# Altium schematic sheet 2_PD Control TPS26750.SchDoc
size A2; Date: Not shown in title block; ApprovedBy: Not shown in title block; CheckedBy: Not shown in title block; Author: Not shown in title block; CompanyName: Not shown in title block; Engineer: Not shown in title block; Organization: Not shown in title block; Address1: Not shown in title block; Address2: Not shown in title block; Address3: Not shown in title block; Address4: Not shown in title block; DocumentNumber: 2; Revision: Use project parameter SCH_Rev; SheetNumber: 2; SheetTotal: 14; PageSetup: Record=PageOptions|CenterHorizontal=True|CenterVertical=True|PrintScale=1.00|XCorrection=1.00|YCorrection=1.00|PrintKind=0|BorderSize=5000000|LeftOffset=0|BottomOffset=0|Orientation=2|PaperLength=1000|PaperWidth=1000|Scale=100|PaperSource=15|PrintQuality=600|MediaType=1|DitherType=10|PaperKind=Letter|PrintScaleMode=1; CurrentTime: Not shown in title block; CurrentDate: Not shown in title block; Time: Not shown in title block; DocumentFullPathAndName: Not shown in title block; DocumentName: Not shown in title block; ModifiedDate: Not shown in title block; ImagePath: Not shown in title block
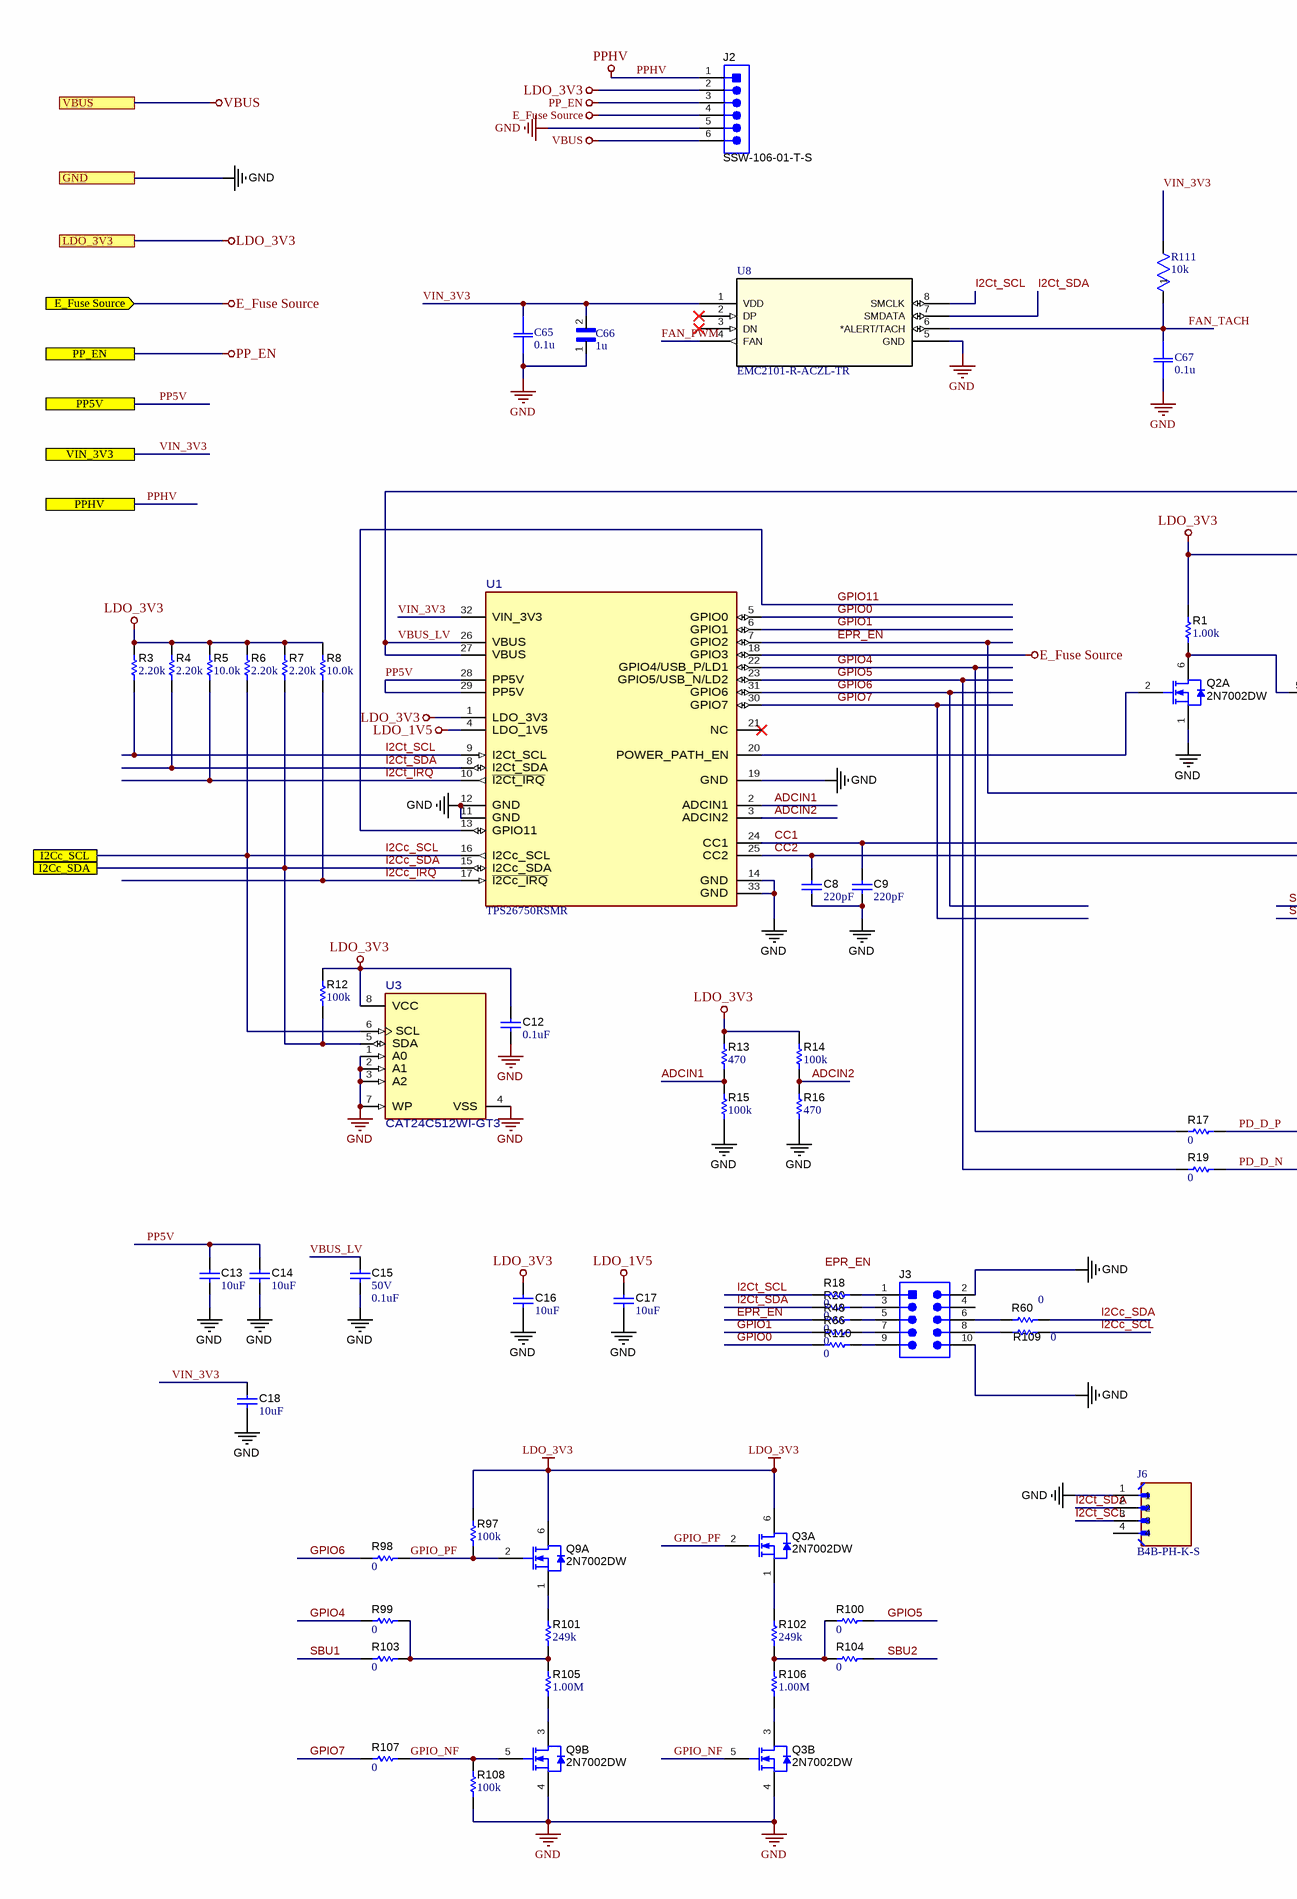
[diagram p0: 2_PD Control TPS26750.SchDoc, left]
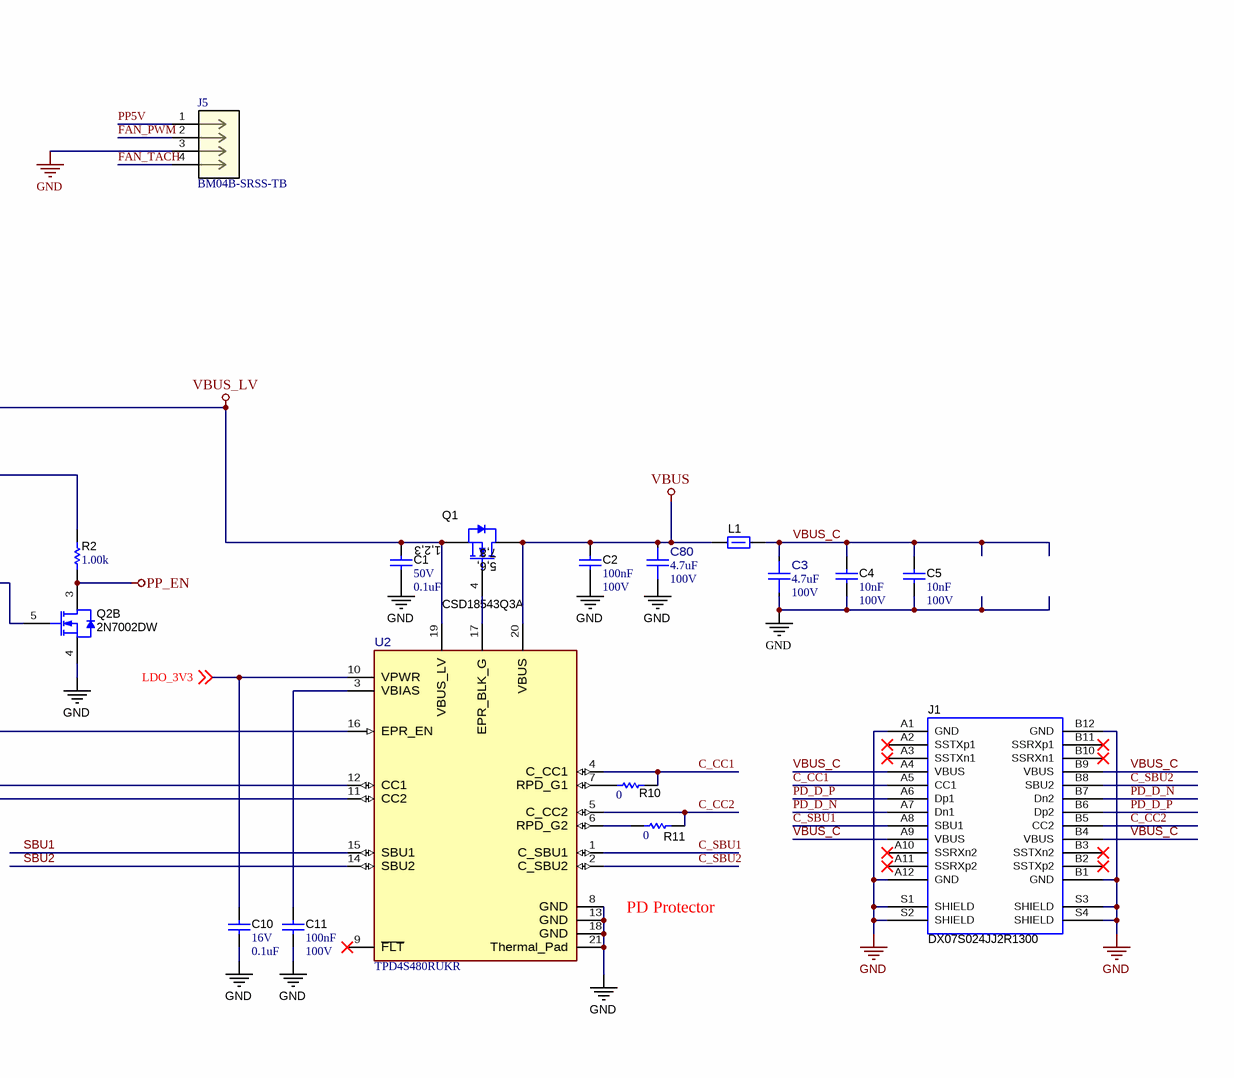
[diagram p1: 2_PD Control TPS26750.SchDoc, right]

## Parts
C1  VDC_V: 50V  ValueDisplayed: 0.1uF  [0402L]  (hidden comment: C1005X5R1H104K050BB)
C2  Cap_F: 100nF  VDC_V: 100V  [0603]  (hidden comment: GRM188R72A104KA35J)
C3  ValueDisplayed: 4.7uF  VDC_V: 100V  [FP-C2012X5R2A475K125AC_0805-MFG]  (hidden comment: C2012X5R2A475K125AC)
C4  Cap_F: 10nF  VDC_V: 100V  [0603L]  (hidden comment: C0603X103K1RACTU)
C5  Cap_F: 10nF  VDC_V: 100V  [0603L]  (hidden comment: C0603X103K1RACTU)
C8  ValueDisplayed: 220pF  [0201_033L]  (hidden comment: CGA1A2X7R1H221K030BA)
C9  ValueDisplayed: 220pF  [0201_033L]  (hidden comment: CGA1A2X7R1H221K030BA)
C10  VDC_V: 16V  ValueDisplayed: 0.1uF  [0402]  (hidden comment: 885012205037)
C11  Cap_F: 100nF  VDC_V: 100V  [0603]  (hidden comment: GRM188R72A104KA35J)
C12  ValueDisplayed: 0.1uF  [0402L]  (hidden comment: CGA2B3X7R1H104K050BB)
C13  ValueDisplayed: 10uF  [0603L]  (hidden comment: GRM188R61E106MA73D)
C14  ValueDisplayed: 10uF  [0603L]  (hidden comment: GRM188R61E106MA73D)
C15  VDC_V: 50V  ValueDisplayed: 0.1uF  [0402L]  (hidden comment: C1005X5R1H104K050BB)
C16  ValueDisplayed: 10uF  [0402_070]  (hidden comment: CL05A106MP5NUNC)
C17  ValueDisplayed: 10uF  [0402_070]  (hidden comment: CL05A106MP5NUNC)
C18  ValueDisplayed: 10uF  [0402_070]  (hidden comment: CL05A106MP5NUNC)
C65  0.1u  [G-188_MUR]
C66  1u  [CAPC2012X145N]
C67  0.1u  [G-188_MUR]
C80  ValueDisplayed: 4.7uF  VDC_V: 100V  [FP-C2012X5R2A475K125AC_0805-MFG]  (hidden comment: C2012X5R2A475K125AC)
J1  DX07S024JJ2R1300  [JAE_DX07S024JJ2R1300]
J2  SSW-106-01-T-S  [Samtec_SSW-106-01-x-S]
J3  PEC05DAAN  [CONN_PEC05DAAN]  (value not drawn)
J5  BM04B-SRSS-TB  [CONN4_BM04B-SRSS_JST]
J6  B4B-PH-K-S  [JST_B4B-PH-K-S]
L1  742792021  [0805L]  (value not drawn)
Q1  CSD18543Q3A  [DNH0008A]
Q2  2N7002DW  [SOT-363]  (parts A,B of 2)
Q3  2N7002DW  [SOT-363]  (parts A,B of 2)
Q9  2N7002DW  [SOT-363]  (parts A,B of 2)
R1  ValueDisplayed: 1.00k  [0402]  (hidden comment: ERJ-2RKF1001X)
R2  ValueDisplayed: 1.00k  [0402]  (hidden comment: ERJ-2RKF1001X)
R3  ValueDisplayed: 2.20k  [0402]  (hidden comment: RC0402FR-072K2L)
R4  ValueDisplayed: 2.20k  [0402]  (hidden comment: RC0402FR-072K2L)
R5  ValueDisplayed: 10.0k  [0402]  (hidden comment: CRCW040210K0DHEDP)
R6  ValueDisplayed: 2.20k  [0402]  (hidden comment: RC0402FR-072K2L)
R7  ValueDisplayed: 2.20k  [0402]  (hidden comment: RC0402FR-072K2L)
R8  ValueDisplayed: 10.0k  [0402]  (hidden comment: CRCW040210K0DHEDP)
R10  ValueDisplayed: 0  [0201L]  (hidden comment: CRCW02010000Z0ED)
R11  ValueDisplayed: 0  [0201L]  (hidden comment: CRCW02010000Z0ED)
R12  ValueDisplayed: 100k  [0201L]  (hidden comment: RC0201FS-7D100KL)
R13  ValueDisplayed: 470  [0603]  (hidden comment: RT0603BRD07470RL)
R14  ValueDisplayed: 100k  [0603L]  (hidden comment: RC0603FR-07100KL)
R15  ValueDisplayed: 100k  [0603L]  (hidden comment: RC0603FR-07100KL)
R16  ValueDisplayed: 470  [0603]  (hidden comment: RT0603BRD07470RL)
R17  ValueDisplayed: 0  [0201L]  (hidden comment: CRCW02010000Z0ED)
R18  ValueDisplayed: 0  [0402]  (hidden comment: RC0402JR-070RL)
R19  ValueDisplayed: 0  [0201L]  (hidden comment: CRCW02010000Z0ED)
R20  ValueDisplayed: 0  [0402]  (hidden comment: RC0402JR-070RL)
R48  ValueDisplayed: 0  [0402]  (hidden comment: RC0402JR-070RL)
R60  ValueDisplayed: 0  [0402]  (hidden comment: RC0402JR-070RL)
R66  ValueDisplayed: 0  [0402]  (hidden comment: RC0402JR-070RL)
R97  ValueDisplayed: 100k  [0402L]  (hidden comment: RC1005F104CS)
R98  ValueDisplayed: 0  [0402]  (hidden comment: RC0402JR-070RL)
R99  ValueDisplayed: 0  [0402]  (hidden comment: RC0402JR-070RL)
R100  ValueDisplayed: 0  [0402]  (hidden comment: RC0402JR-070RL)
R101  ValueDisplayed: 249k  [0603]  (hidden comment: RG1608P-2493-B-T5)
R102  ValueDisplayed: 249k  [0603]  (hidden comment: RG1608P-2493-B-T5)
R103  ValueDisplayed: 0  [0402]  (hidden comment: RC0402JR-070RL)
R104  ValueDisplayed: 0  [0402]  (hidden comment: RC0402JR-070RL)
R105  ValueDisplayed: 1.00M  [0402L]  (hidden comment: ERJ-2RKF1004X)
R106  ValueDisplayed: 1.00M  [0402L]  (hidden comment: ERJ-2RKF1004X)
R107  ValueDisplayed: 0  [0402]  (hidden comment: RC0402JR-070RL)
R108  ValueDisplayed: 100k  [0402L]  (hidden comment: RC1005F104CS)
R109  ValueDisplayed: 0  [0402]  (hidden comment: RC0402JR-070RL)
R110  ValueDisplayed: 0  [0402]  (hidden comment: RC0402JR-070RL)
R111  10k  [RC0402N_VIS]
U1  TPS26750RSMR  [RSM0032B-MFG]
U2  TPD4S480RUKR  [RUK0020B-MFG]
U3  CAT24C512WI-GT3  [FP-CAT24C512WI-GT3_SOIC8-IPC_C]
U8  EMC2101-R-ACZL-TR  [MSOP8_MC_MCH]

## Ports
E_Fuse Source (in), GND, I2Cc_SCL, I2Cc_SDA, LDO_3V3, PP5V, PP_EN, PPHV, VBUS, VIN_3V3

## Nets
E_Fuse Source: J2.4 U1.18(GPIO3) ; port E_Fuse Source
GND: C1.2 C2.2 C3.1 C4.2 C5.2 C8.2 C9.2 C10.2 C11.1 C12.2 C13.2 C14.2 C15.2 C16.1 C17.1 C18.2 C65.1 C66.1 C67.1 C80.1 J1.A1(GND) J1.A12(GND) J1.B1(GND) J1.B12(GND) J1.S1(SHIELD) J1.S2(SHIELD) J1.S3(SHIELD) J1.S4(SHIELD) J2.5 J3.2 J3.10 J5.3 J6.1 Q2.1(S) Q2.4(S) Q3.4(S) Q9.4(S) R15.1 R16.1 R108.1 U1.11(GND) U1.12(GND) U1.14(GND) U1.19(GND) U1.33(GND) U2.8(GND) U2.13(GND) U2.18(GND) U2.21(Thermal_Pad) U3.1(A0) U3.2(A1) U3.3(A2) U3.4(VSS) U3.7(WP) U8.5(GND) ; port GND
LDO_1V5: C17.2 U1.4(LDO_1V5)
LDO_3V3: C10.1 C12.1 C16.2 J2.2 Q3.6(D) Q9.6(D) R1.2 R2.2 R3.2 R4.2 R5.2 R6.2 R7.2 R8.2 R12.2 R13.2 R14.2 R97.2 U1.1(LDO_3V3) U2.10(VPWR) U3.8(VCC) ; off-sheet LDO_3V3, port LDO_3V3
PP_EN: J2.3 Q2.3(D) R2.1 ; port PP_EN
PPHV: J2.1 ; port PPHV
VBUS: C2.1 C80.2 J2.6 L1.1 Q1.5(D) Q1.6(D) Q1.7(D) Q1.8(D) Q1.9(D) U2.20(VBUS) ; port VBUS
VBUS_LV: C1.1 C15.1 Q1.1(S) Q1.2(S) Q1.3(S) U1.26(VBUS) U1.27(VBUS) U2.19(VBUS_LV)
ADCIN1: R13.1 R15.2 U1.2(ADCIN1)
ADCIN2: R14.1 R16.2 U1.3(ADCIN2)
C_CC1: J1.A5(CC1) R10.2 U2.4(C_CC1)
C_CC2: J1.B5(CC2) R11.2 U2.5(C_CC2)
C_SBU1: J1.A8(SBU1) U2.1(C_SBU1)
C_SBU2: J1.B8(SBU2) U2.2(C_SBU2)
CC1: C9.1 U1.24(CC1) U2.12(CC1)
CC2: C8.1 U1.25(CC2) U2.11(CC2)
EPR_EN: R48.1 U1.7(GPIO2) U2.16(EPR_EN)
FAN_PWM: J5.2 U8.4(FAN)
FAN_TACH: C67.2 J5.4 R111.1 U8.6(*ALERT/TACH)
GPIO0: R110.1 U1.5(GPIO0)
GPIO1: R66.1 U1.6(GPIO1)
GPIO4: R17.1 R99.1 U1.22(GPIO4/USB_P/LD1)
GPIO5: R19.1 R100.2 U1.23(GPIO5/USB_N/LD2)
GPIO6: R98.1 U1.31(GPIO6)
GPIO7: R107.1 U1.30(GPIO7)
GPIO11: U1.13(GPIO11)
GPIO_NF: Q3.5(G) Q9.5(G) R107.2 R108.2
GPIO_PF: Q3.2(G) Q9.2(G) R97.1 R98.2
I2Cc_SCL: R6.1 R109.2 U1.16(I2Cc_SCL) U3.6(SCL) ; port I2Cc_SCL
I2Cc_SDA: R7.1 R12.1 R60.2 U1.15(I2Cc_SDA) U3.5(SDA) ; port I2Cc_SDA
I2Ct_SCL: J6.3 R3.1 R18.1 U1.9(I2Ct_SCL) U8.8(SMCLK)
I2Ct_SDA: J6.2 R4.1 R20.1 U1.8(I2Ct_SDA) U8.7(SMDATA)
~{I2Cc_IRQ}: R8.1 U1.17(~{I2Cc_IRQ})
~{I2Ct_IRQ}: R5.1 U1.10(~{I2Ct_IRQ})
PD_D_N: J1.A7(Dn1) J1.B7(Dn2) R19.2
PD_D_P: J1.A6(Dp1) J1.B6(Dp2) R17.2
PP5V: C13.1 C14.1 J5.1 U1.28(PP5V) U1.29(PP5V) ; port PP5V
SBU1: R103.1 U2.15(SBU1)
SBU2: R104.2 U2.14(SBU2)
VBUS_C: C3.2 C4.1 C5.1 J1.A4(VBUS) J1.A9(VBUS) J1.B4(VBUS) J1.B9(VBUS) L1.2
VIN_3V3: C18.1 C65.2 C66.2 R111.2 U1.32(VIN_3V3) U8.1(VDD) ; port VIN_3V3
NetC11_2: C11.2 U2.3(VBIAS)
NetJ3_1: J3.1 R18.2
NetJ3_3: J3.3 R20.2
NetJ3_5: J3.5 R48.2
NetJ3_6: J3.6 R60.1
NetJ3_7: J3.7 R66.2
NetJ3_8: J3.8 R109.1
NetJ3_9: J3.9 R110.2
NetQ1_4: Q1.4(G) U2.17(EPR_BLK_G)
NetQ2_2: Q2.2(G) U1.20(POWER_PATH_EN)
NetQ2_5: Q2.5(G) Q2.6(D) R1.1
NetQ3_1: Q3.1(S) R102.2
NetQ3_3: Q3.3(D) R106.1
NetQ9_1: Q9.1(S) R101.2
NetQ9_3: Q9.3(D) R105.1
NetR10_1: R10.1 U2.7(RPD_G1)
NetR11_1: R11.1 U2.6(RPD_G2)
NetR99_2: R99.2 R101.1 R103.2 R105.2
NetR100_1: R100.1 R102.1 R104.1 R106.2

Not connected (* = marked no-connect by the designer): J1 A2(SSTXp1)* A3(SSTXn1)* A10(SSRXn2)* A11(SSRXp2)* B2(SSTXp2)* B3(SSTXn2)* B10(SSRXn1)* B11(SSRXp1)*; J3 4; J6 4; U1 21(NC)*; U2 9(~{FLT})*; U8 2(DP)* 3(DN)*

## Notes on the sheet
- (near U2) PD Protector
- Labels drawn without touching a wire or pin: EPR_EN
- Orderable:
- Designed for:
- Mod. Date:
- Texas Instruments and/or its licensors do not warrant the accuracy or completeness of this specification or any information contained therein. Texas Instruments and/or its licensors do not warrant that this design will meet the specifications, will be suitable for your application or fit for any particular purpose, or will operate in an implementation. Texas Instruments and/or its licensors do not warrant that the design is production worthy. You should completely validate and test your design implementation to confirm the system functionality for your application.
- Drawn By:
- Engineer:
- SVN Rev:
- Number:
- TID #:
- Rev:
- Sheet Title:
- File:
- Contact:
- Project Title:
- Assembly Variant:
- Sheet:
- Size:
- of
- A2
- © Texas Instruments
- http://www.ti.com
- (in symbol CMP-0000826-2) 1,2,3; 7,8; 5,6,

## Library data of the parts
C1 C15 = CMP-0006279-2: CAP, CERM, 0.1 uF, 50 V, +/- 10%, X5R, 0402; Manufacturer: TDK; TaMin_C: -55°C; ESR_ohm: 39.064m; Polarized: N; SizeAreaWB_mm2: 3; Value1: 0.039064 ohm; U/M: EA; Value: 0.1uF; TaMax_C: 85°C; SizeZ_mm: 0.6; SizeX_mm: 1; SizeY_mm: 0.5; Cap_Case: 0402; Cap_F: 100nF; IRMS_A: 814.669mA; AEC Category: Q200; Supplier Part Number 2: 810-C1005X5R1H104K050BB; Publisher: Texas Instruments; Supplier 2: Mouser; TempCo: X5R; Published: 2008-06-19; RoHS: Y; MountType: SMT; Supplier 1: Digi-Key; PackageReference: 0402; Tolerance_%: 10%; Value2: 50V; SizeArea_mm2: 0.5; CompType: Capacitor; LatestRevisionDate: 2017-03-09; PartNumber: C1005X5R1H104K050BB; AEC Qualified: N; ComponentLink1Description: Datasheet link; AEC Grade: N/A; Supplier Part Number 1: 445-5942-1-ND; Technology: Ceramic; ComponentLink1URL: https://product.tdk.com/en/search/capacitor/ceramic/mlcc/info?part_no=C1005X5R1H104K050BB
C2 C11 = CMP-0007470-4: CAP, CERM, 0.1 uF, 100 V, +/- 10%, X7R, 0603; Manufacturer: MuRata; TaMin_C: -55°C; Polarized: N; SizeAreaWB_mm2: 4.68; Value1: Unknown; U/M: EA; Value: 0.1uF; TaMax_C: 125°C; SizeZ_mm: 1; SizeX_mm: 1.6; SizeY_mm: 0.8; SizeArea_mm2: 1.28; AEC Category: Q200; Supplier Part Number 2: 81-GRM188R72A104KA5J; Publisher: Texas Instruments; Supplier 2: Mouser; TempCo: X7R; Published: 2008-06-19; RoHS: Y; MountType: SMT; Supplier 1: Digi-Key; PackageReference: 0603; Tolerance_%: 10%; Cap_Case: 0603; Value2: 100V; CompType: Capacitor; LatestRevisionDate: 2017-03-09; PartNumber: GRM188R72A104KA35J; AEC Qualified: ?; ComponentLink1Description: Datasheet link; Supplier Part Number 1: 490-6439-1-ND; Technology: Ceramic; ValueDisplayed: 0.1uF; ComponentLink1URL: http://search.murata.co.jp/Ceramy/image/img/A01X/G101/ENG/GRM188R72A104KA35-01.pdf
C3 C80 = CMP-0098058-1: 4.7 µF ±10% 100V Ceramic Capacitor X5R 0805 (2012 Metric); Manufacturer: TDK; AEC Qualified: No; SizeZ_mm: 1.5mm; Value: 4.7µF; TempCo: 15%; ComponentLink1URL: https://product.tdk.com/en/search/capacitor/ceramic/mlcc/info?part_no=C2012X5R2A475K125AC; helpURL: https://upverter.com/upn/revision/d7b95d178f122935/; Datasheet Path: datasheets/Cap-C2012X5R2A475K125AC.pdf; datasheet: https://product.tdk.com/en/search/capacitor/ceramic/mlcc/info?part_no=C2012X5R2A475K125AC; Supplier Part Number 1: 445-C2012X5R2A475K125ACCT-ND; ComponentLink1Description: Datasheet; PackageReference: 0805; Tolerance_%: 10%; Mouser Description: Multilayer Ceramic Chip Capacitors, Capacitance=4.7µF, LxWxT: 2x1.25x1.25mm; Supplier 2: Mouser; Supplier Part Number 2: 810-C2012X5R2A475K12; Part Number: C2012X5R2A475K125AC; Cap_F: 4.7µF; Temperature Characteristic: X5R; Supplier 1: Digikey; Lead Free: Yes; Digikey Part Number: 445-C2012X5R2A475K125ACCT-ND; Operating Temperature Range: -55°C to +85°C; Digikey Description: CAP CER 4.7UF 100V X5R 0805; RoHS: TRUE; PartNumber: C2012X5R2A475K125AC; Mouser Part Number: 810-C2012X5R2A475K12
C4 C5 = CMP-0006977-4: CAP, CERM, 0.01 uF, 100 V, +/- 10%, X7R, 0603; Manufacturer: Kemet; TaMin_C: -55°C; Polarized: N; SizeAreaWB_mm2: 4.68; Value1: Unknown; U/M: EA; Value: 0.01uF; TaMax_C: 125°C; SizeZ_mm: 1; SizeX_mm: 1.6; SizeY_mm: 0.8; Cap_Case: 0603; SizeArea_mm2: 1.28; AEC Category: Q200; Supplier Part Number 2: 80-C0603X103K1R; Publisher: Texas Instruments; Supplier 2: Mouser; TempCo: X7R; Published: 2008-06-19; RoHS: Y; MountType: SMT; Supplier 1: Digi-Key; PackageReference: 0603; Tolerance_%: 10%; Value2: 100V; CompType: Capacitor; LatestRevisionDate: 2017-03-09; PartNumber: C0603X103K1RACTU; AEC Qualified: ?; ComponentLink1Description: Datasheet link; Supplier Part Number 1: 399-5347-1-ND; Technology: Ceramic; ValueDisplayed: 0.01uF; ComponentLink1URL: http://www.kemet.com/kemet/web/homepage/kechome.nsf/vapubfiles/F3102_Y5V.pdf/$file/F3102_Y5V.pdf
C8 C9 = CMP-0009652-3: CAP, CERM, 220 pF, 50 V, +/- 10%, X7R, AEC-Q200 Grade 1, 0201; Manufacturer: TDK; TaMin_C: -55°C; ESR_ohm: 11.6275; Polarized: N; SizeAreaWB_mm2: 2.08; Value1: 11.6275 ohm; U/M: EA; Value: 220pF; TaMax_C: 125°C; SizeZ_mm: 0.33; SizeX_mm: 0.6; SizeY_mm: 0.3; Cap_Case: 0201_033; Value2: 50V; SizeArea_mm2: 0.18; AEC Qualified: Y; IRMS_A: 200.785mA; AEC Grade: 1; AEC Category: Q200; Supplier Part Number 2: 810-CGA1A2X7R1H221K030BA; Publisher: Texas Instruments; Supplier 2: Mouser; TempCo: X7R; Published: 2008-06-19; RoHS: Y; MountType: SMT; Supplier 1: Digi-Key; PackageReference: 0201; Tolerance_%: 10%; CompType: Capacitor; LatestRevisionDate: 2017-03-09; PartNumber: CGA1A2X7R1H221K030BA; Cap_F: 220pF; VDC_V: 50V; ComponentLink1Description: Datasheet link; Supplier Part Number 1: 445-12109-1-ND; Technology: Ceramic; ComponentLink1URL: https://product.tdk.com/en/search/capacitor/ceramic/mlcc/info?part_no=CGA1A2X7R1H221K030BA
C10 = CMP-0006228-1: CAP, CERM, 0.1 uF, 16 V, +/- 10%, X7R, 0402; Manufacturer: Wurth Elektronik; TaMin_C: -55°C; Polarized: N; SizeAreaWB_mm2: 3; Value1: Unknown; U/M: EA; Value: 0.1uF; TaMax_C: 125°C; SizeZ_mm: 0.6; SizeX_mm: 1; SizeY_mm: 0.5; Cap_F: 100nF; AEC Category: Q200; ComponentLink1URL: http://katalog.we-online.de/pbs/datasheet/885012205037.pdf; Supplier Part Number 2: 710-885012205037; Publisher: Texas Instruments; Supplier 2: Mouser; TempCo: X7R; Published: 2008-06-19; RoHS: Y; MountType: SMT; Supplier 1: Digi-Key; PackageReference: 0402; Tolerance_%: 10%; Cap_Case: 0402; Value2: 16V; SizeArea_mm2: 0.5; CompType: Capacitor; LatestRevisionDate: 2017-03-09; PartNumber: 885012205037; AEC Qualified: N; ComponentLink1Description: Datasheet link; AEC Grade: N/A; Supplier Part Number 1: 732-7532-1-ND; Technology: Ceramic
C12 = CMP-0006325-2: CAP, CERM, 0.1 uF, 50 V, +/- 10%, X7R, AEC-Q200 Grade 1, 0402; Manufacturer: TDK; TaMin_C: -55°C; ESR_ohm: 39.064m; Polarized: N; SizeAreaWB_mm2: 3; Value1: 0.039064 ohm; U/M: EA; Value: 0.1uF; TaMax_C: 125°C; SizeZ_mm: 0.6; SizeX_mm: 1; SizeY_mm: 0.5; Cap_Case: 0402; Value2: 50V; AEC Qualified: Y; Cap_F: 100nF; IRMS_A: 814.669mA; AEC Category: Q200; Supplier Part Number 2: 04X3148; Publisher: Texas Instruments; Supplier 2: Newark; Supplier Part Number 3: 810-CGA2B3X7R1H104K; TempCo: X7R; Supplier 3: Mouser; Published: 2008-06-19; RoHS: Y; MountType: SMT; Supplier 1: Digi-Key; PackageReference: 0402; Tolerance_%: 10%; SizeArea_mm2: 0.5; CompType: Capacitor; LatestRevisionDate: 2017-03-09; PartNumber: CGA2B3X7R1H104K050BB; VDC_V: 50V; ComponentLink1Description: Datasheet link; AEC Grade: 1; Supplier Part Number 1: 445-6899-1-ND; Technology: Ceramic; ComponentLink1URL: https://product.tdk.com/en/search/capacitor/ceramic/mlcc/info?part_no=CGA2B3X7R1H104K050BB
C13 C14 = CMP-0007344-5: CAP, CERM, 10 uF, 25 V, +/- 20%, X5R, 0603; Manufacturer: MuRata; TaMin_C: -55°C; Polarized: N; SizeAreaWB_mm2: 4.68; Value1: Unknown; U/M: EA; Value: 10uF; TaMax_C: 85°C; SizeZ_mm: 1; SizeX_mm: 1.6; SizeY_mm: 0.8; Cap_Case: 0603; Value2: 25V; SizeArea_mm2: 1.28; Cap_F: 10µF; AEC Category: Q200; Supplier Part Number 2: 81-GRM188R61E106MA3L; Publisher: Texas Instruments; Supplier 2: Mouser; Supplier Part Number 3: 1828803RL; TempCo: X5R; Supplier 3: Farnell; Published: 2008-06-19; RoHS: Y; MountType: SMT; Supplier 1: Digi-Key; PackageReference: 0603; Tolerance_%: 20%; CompType: Capacitor; LatestRevisionDate: 2017-03-09; PartNumber: GRM188R61E106MA73D; AEC Qualified: ?; VDC_V: 25V; ComponentLink1Description: Datasheet link; Supplier Part Number 1: 490-7202-1-ND; Technology: Ceramic; ComponentLink1URL: http://psearch.murata.com/capacitor/product/GRM188R61E106MA73%23.pdf
C16-C18 = CMP-0006339-4: CAP, CERM, 10 uF, 10 V, +/- 20%, X5R, 0402; Manufacturer: Samsung Electro-Mechanics; TaMin_C: -55°C; Polarized: N; SizeAreaWB_mm2: 3; Value1: Unknown; U/M: EA; Value: 10uF; TaMax_C: 85°C; SizeZ_mm: 0.6; SizeX_mm: 1; SizeY_mm: 0.5; Cap_Case: 0402; Value2: 10V; Cap_F: 10µF; AEC Category: Q200; TempCo: X5R; RoHS: Y; MountType: SMT; PackageReference: 0402; Tolerance_%: 20%; SizeArea_mm2: 0.5; CompType: Capacitor; PartNumber: CL05A106MP5NUNC; AEC Qualified: N; VDC_V: 10V; ComponentLink1Description: Datasheet link; Technology: Ceramic; ComponentLink1URL: http://www.samsungsem.com/kr/support/product-search/mlcc/__icsFiles/afieldfile/2018/06/21/CL05A106MP5NUNC.pdf; AEC Grade: N/A
C65 C67 = GRM188R72A104KA35J: CAP, CERM, 0.1 uF, 100 V, +/- 10%, X7R, 0603; Manufacturer_Name: Murata; Copyright: Copyright (C) 2026 Ultra Librarian. All rights reserved.; Manufacturer_Part_Number: GRM188R72A104KA35J
C66 = C2012X7S2A105K125AB: 1 ÂµF Â±10% 100V Ceramic Capacitor X7S 0805 (2012 Metric); MF: {'manufacturer': u'TDK Corporation'}; Package: None; Price: None; Value: *; MP: C2012X7S2A105K125AB; Availability: Unavailable
J1 = CMP-0085712-2: Receptacle, USB 3.1 Type C, R/A, Gold, SMT; Manufacturer: JAE Electronics; Current_A: 1.25A; Gender: Female; Voltage_V: 20V; Pitch_mm: 0.5; Row_Count: 2; ComponentLink1Description: Datasheet URL; CompType: USB; ComponentLink1URL: http://www.jae.com/z-en/pdf_download_exec.cfm?param=SJ115946.pdf; PinCount: 24; ContactFinish: Gold; PartNumber: DX07S024JJ2R1300; MountType: SMT; PackageReference: Receptacle, USB 3.1 Type C, R/A, SMT; Orientation: R/A; Color: Black; RoHS: Y
J2 = CMP-0075621-1: Receptacle, 6x1, 2.54mm, Tin, TH; Manufacturer: Samtec; Pitch_mm: 2.54; Gender: Female; Cert_CSA: Y; Current_A: 5.7A; CT: False; Row_Count: 1; ComponentLink1Description: Datasheet URL; RoHS: Y; Supplier 1: Digi-Key; Cert_UL: Y; Orientation: Vertical; PackageReference: Receptacle, 6x1, 2.54mm, TH; Color: Black; PartNumber: SSW-106-01-T-S; PinCount: 6; Publisher: Texas Instruments; ContactFinish: Tin; ComponentLink1URL: http://suddendocs.samtec.com/catalog_english/ssw_sm.pdf; LatestRevisionDate: 2017-07-12; CompType: Receptacle; CNHeader: False; MountType: TH; Supplier Part Number 1: SAM1213-06-ND
J3 = CMP-0054550-2: Header, 100mil, 5x2, Tin, TH; Manufacturer: Sullins Connector Solutions; Current_A: 3A; Green_Lifecycle: Active; Shrouded: N; Gender: Male; Green_REACh: Passed; Voltage_V: 1.8kV; Row_Count: 2; RowSpacing_mm: 2.54; Cert_UL: Y; ComponentLink1URL: http://www.sullinscorp.com/catalogs/77_PAGE108-109_.100_MALE_HDR.pdf; ClassName: Header; Color: Black; RoHS: Y; MountType: TH; Green_EU RoHS-2: Passed; Supplier 1: Digi-Key; Green_EU RoHS: Passed; PackageReference: Header, 5x2, 100mil, Tin; PinCount: 10; CompType: Header; PartNumber: PEC05DAAN; Orientation: Vertical; ComponentLink1Description: Datasheet URL; Supplier Part Number 1: S2012E-05-ND; Pitch_mm: 2.54; ContactFinish: Tin
J5 = BM04B-SRSS-TB: Description; Manufacturer_Name: JST; Type: Headers, Male Pins; Copyright: Copyright (C) 2025 Ultra Librarian. All rights reserved.; Manufacturer_Part_Number: BM04B-SRSS-TB; RefDes: RefDes
J6 = B4B-PH-K-S: MF: {'manufacturer': u'JST Sales America Inc.'}; Package: None; Price: None; Value: *; MP: B4B-PH-K-S; Availability: Unavailable
L1 = CMP-0003072-1: Ferrite Bead, 22 ohm @ 100 MHz, 6 A, 0805; Manufacturer: Wurth Elektronik; Ztyp@1GHz_Ohm: 40.219; ZTyp@100MHz_Ohm: 22; SizeAreaWB_mm2: 6.75; DCR_ohm: 8m; Value1: 0.008 ohm; Value: 22 ohm; Imax_A: 6A; SizeZ_mm: 1.45; SizeX_mm: 2; SizeY_mm: 1.25; SizeArea_mm2: 2.5; ComponentLink1URL: http://katalog.we-online.de/pbs/datasheet/742792021.pdf; Supplier Part Number 2: 710-742792021; Publisher: Texas Instruments; Supplier 2: Mouser; Published: 2014-04-30; RoHS: Y; MountType: SMT; Supplier 1: Digi-Key; PackageReference: 0805; Value2: 6A; CompType: Ferrite Bead; LatestRevisionDate: 2017-03-09; PartNumber: 742792021; ComponentLink1Description: Datasheet link; Supplier Part Number 1: 732-4637-1-ND; ValueDisplayed: 22 ohm
Q1 = CMP-0000826-2: MOSFET, N-CH, 60 V, 35 A, DNH0008A (VSONP-8); Alternate Manufacturer: None; Manufacturer: Texas Instruments; SizeZ_mm: 0.9; ChType: N; Value2: 11.1 nC; Value1: 0.01; VdsMax_V: 60V; SizeX_mm: 3.3; SizeAreaWB_mm2: 18.49; Vgs_V: 20V; QgTyp_nC: 11.1; Value: 60V; Rdson45_ohm: 12m; SizeArea_mm2: 10.89; AEC Category: Q101; IdsMax_A: 35A; ChMode: Enhancement; Supplier 1: Digi-Key; Supplier Part Number 1: CSD18543Q3A-ND; PartNumber: CSD18543Q3A; ComponentLink1Description: Datasheet link; ComponentLink1URL: http://www.ti.com/lit/ds/symlink/csd18543q3a.pdf; SizeY_mm: 3.3; CompType: MOSFET; AEC Qualified: N; RoHS: Y; PackageReference: DNH0008A; MountType: SMT
Q2 Q3 Q9 = CMP-0000770-1: MOSFET, 2-CH, N-CH, 60 V, 0.115 A, SOT-363; Alternate Manufacturer: None; Manufacturer: Fairchild Semiconductor; SizeZ_mm: 1.1; ChType: N; VdsMax_V: 60V; SizeX_mm: 2.2; Vgs_V: 20V; Value: 60V; SizeArea_mm2: 4.84; AEC Category: Q101; IdsMax_A: 115mA; SizeAreaWB_mm2: 10.24; U/M: EA; Supplier 2: Newark; Supplier 3: Farnell; Supplier 1: Digi-Key; Supplier Part Number 1: 2N7002DWCT-ND; Supplier Part Number 2: 05R0387; PartNumber: 2N7002DW; ComponentLink1Description: Datasheet link; LatestRevisionDate: 2017-03-09; ComponentLink1URL: https://www.fairchildsemi.com/datasheets/2N/2N7002DW.pdf; SizeY_mm: 2.2; CompType: MOSFET; PackageReference: SOT-363; LatestRevisionNote: Added parts.; Publisher: Texas Instruments; AEC Qualified: N; Published: 2008-06-19; Supplier Part Number 3: 2464117; RoHS: Y; MountType: SMT
R1 R2 = CMP-0026657-1: RES, 1.00 k, 1%, 0.1 W, 0402; Manufacturer: Panasonic; Power_W: 100mW; TempCo: 100 ppm/C; Value_Code: 1k00; U/M: EA; Value: 1.00k; EIA_Code: E96; Res_ohm: 1k; SizeX_mm: 1; SizeY_mm: 0.5; SizeZ_mm: 0.6; Value2: 0.1W; VDC_V: 50V; AEC Category: Q200; ComponentLink1URL: http://industrial.panasonic.com/www-data/pdf/AOA0000/AOA0000CE2.pdf; Supplier Part Number 2: 64R5247; Publisher: Texas Instruments; Supplier 2: Newark; Supplier Part Number 3: 667-ERJ-2RKF1001X; Supplier 3: Mouser; Published: 2008-06-26; RoHS: Y; Value1: 1%; MountType: SMT; Supplier 1: Digi-Key; PackageReference: 0402; Tolerance_%: 1%; SizeArea_mm2: 0.5; CompType: Resistor; LatestRevisionDate: 2017-03-09; PartNumber: ERJ-2RKF1001X; AEC Qualified: ?; ComponentLink1Description: Datasheet link; Supplier Part Number 1: P1.00KLCT-ND; Technology: Thick Film
R3 R4 R6 R7 = CMP-0026729-1: RES, 2.20 k, 1%, 0.063 W, 0402; Manufacturer: Yageo America; Power_W: 63mW; TempCo: 100 ppm/C; Value_Code: 2k20; U/M: EA; Value: 2.20k; Res_ohm: 2.2k; SizeX_mm: 1; SizeY_mm: 0.5; SizeZ_mm: 0.6; Value2: 0.063W; AEC Qualified: N; AEC Category: Q200; ComponentLink1URL: http://www.yageo.com/documents/recent/PYu-RC_Group_51_RoHS_L_1.pdf; Supplier Part Number 2: 67R9903; Publisher: Texas Instruments; Supplier 2: Newark; Supplier Part Number 3: 603-RC0402FR-072K2L; Supplier 3: Mouser; Published: 2008-06-26; RoHS: Y; Value1: 1%; MountType: SMT; Supplier 1: Digi-Key; PackageReference: 0402; Tolerance_%: 1%; SizeArea_mm2: 0.5; CompType: Resistor; LatestRevisionDate: 2017-03-09; PartNumber: RC0402FR-072K2L; ComponentLink1Description: Datasheet link; AEC Grade: N/A; Supplier Part Number 1: 311-2.20KLRCT-ND; Technology: Thick Film
R5 R8 = CMP-0026769-1: RES, 10.0 k, 0.5%, 0.063 W, 0402; Manufacturer: Vishay-Dale; Power_W: 63mW; TempCo: 50 ppm/C; Value_Code: 10k0; U/M: EA; Value: 10.0k; EIA_Code: E192; Res_ohm: 10k; SizeX_mm: 1; SizeY_mm: 0.5; SizeZ_mm: 0.6; Value2: 0.063W; VDC_V: 50V; AEC Category: Q200; ComponentLink1URL: http://www.vishay.com/docs/20036/dcrcwpe3.pdf; Supplier Part Number 2: 51X8307; Publisher: Texas Instruments; Supplier 2: Newark; Supplier Part Number 3: 71-CRCW040210K0DHEDP; Supplier 3: Mouser; Published: 2008-06-26; RoHS: Y; Value1: 0.5%; MountType: SMT; Supplier 1: Digi-Key; PackageReference: 0402; Tolerance_%: 0.5%; SizeArea_mm2: 0.5; CompType: Resistor; LatestRevisionDate: 2017-03-09; PartNumber: CRCW040210K0DHEDP; AEC Qualified: ?; ComponentLink1Description: Datasheet link; Supplier Part Number 1: 541-10KAVCT-ND; Technology: Thick Film
R10 R11 R17 R19 = CMP-0027008-4: RES, 0, 5%, 0.05 W, 0201; Manufacturer: Vishay-Dale; Power_W: 50mW; TempCo: ppm/C; Value_Code: 0000; Value: 0; EIA_Code: E24; SizeX_mm: 0.6; SizeY_mm: 0.3; SizeZ_mm: 0.26; Value2: 0.05W; SizeArea_mm2: 0.18; AEC Qualified: N; AEC Category: Q200; ComponentLink1URL: http://www.vishay.com/docs/20052/crcw0201e3.pdf; RoHS: E; Value1: 5%; MountType: SMT; Supplier 1: Newark; PackageReference: 0201; Tolerance_%: 5%; Res_ohm: 0; CompType: Resistor; PartNumber: CRCW02010000Z0ED; ComponentLink1Description: Datasheet link; AEC Grade: N/A; Supplier Part Number 1: 72M6743; Technology: Thick Film
R12 = CMP-0028069-1: RES, 100 k, 1%, 0.05 W, 0201; Manufacturer: Yageo America; Power_W: 50mW; TempCo: 200 ppm/C; U/M: EA; Value: 100k; EIA_Code: E96; SizeX_mm: 0.6; SizeY_mm: 0.3; SizeZ_mm: 0.26; Value2: 0.05W; SizeArea_mm2: 0.18; AEC Qualified: N; VDC_V: 25V; AEC Category: Q200; ComponentLink1URL: http://www.yageo.com/documents/recent/PYu-RC_Group_51_RoHS_L_5.pdf; Publisher: Texas Instruments; Published: 2016-10-14; Value_Code: 100k; RoHS: Y; Value1: 1%; MountType: SMT; Supplier 1: Mouser; PackageReference: 0201; Tolerance_%: 1%; Res_ohm: 100k; CompType: Resistor; LatestRevisionDate: 2017-03-09; PartNumber: RC0201FS-7D100KL; ComponentLink1Description: Datasheet link; AEC Grade: N/A; Supplier Part Number 1: 603-RC0201FS-7D100KL; Technology: Thick Film
R13 R16 = CMP-0024263-1: RES, 470, 0.1%, 0.1 W, 0603; Manufacturer: Yageo America; Power_W: 100mW; TempCo: 25 ppm/C; Value_Code: 470R; U/M: EA; Value: 470; EIA_Code: E192; SizeX_mm: 1.6; SizeY_mm: 0.8; SizeZ_mm: 1; Value2: 0.1W; SizeArea_mm2: 1.28; VDC_V: 75V; AEC Category: Q200; ComponentLink1URL: http://www.yageo.com/pdf/PYu-RT_1-to-0.05_RoHS_L_3.pdf; Publisher: Texas Instruments; Published: 2008-06-26; RoHS: Y; Value1: 0.1%; MountType: SMT; PackageReference: 0603; Tolerance_%: 0.1%; Res_ohm: 470; CompType: Resistor; LatestRevisionDate: 2017-03-09; PartNumber: RT0603BRD07470RL; AEC Qualified: ?; ComponentLink1Description: Datasheet link; Technology: Thin Film
R14 R15 = CMP-0022735-5: RES, 100 k, 1%, 0.1 W, 0603; Manufacturer: Yageo; Power_W: 100mW; TempCo: 100 ppm/C; Value: 100k; EIA_Code: E96; SizeX_mm: 1.6; SizeY_mm: 0.8; SizeZ_mm: 1; Value2: 0.1W; SizeArea_mm2: 1.28; AEC Qualified: N; VDC_V: 75V; AEC Category: Q200; SizeAreaWB_mm2: 4.68; Supplier Part Number 2: 603-RC0603FR-07100KL; Supplier 2: Mouser; Supplier Part Number 3: 9238727; Supplier 3: Farnell; Value_Code: 100k; RoHS: Y; Value1: 1%; MountType: SMT; Supplier 1: Digi-Key; PackageReference: 0603; Tolerance_%: 1%; Res_ohm: 100k; CompType: Resistor; PartNumber: RC0603FR-07100KL; ComponentLink1Description: Datasheet link; Supplier Part Number 1: 311-100KHRCT-ND; Technology: Thick Film; ComponentLink1URL: http://www.yageo.com/pdf/Pu-RC0603_51_PbFree_L_2.pdf; AEC Grade: N/A
R18 R20 R48 R60 R66 R98-R100 R103 R104 R107 R109 R110 = CMP-0027004-1: RES, 0, 5%, 0.063 W, 0402; Manufacturer: Yageo America; Power_W: 63mW; TempCo: 200 ppm/C; Value_Code: 0000; U/M: EA; Value: 0; EIA_Code: E24; SizeX_mm: 1; SizeY_mm: 0.5; SizeZ_mm: 0.6; Value2: 0.063W; VDC_V: 50V; AEC Category: Q200; ComponentLink1URL: http://www.yageo.com/pdf/Pu-RC0402_51_PbFree_L_2.pdf; Supplier Part Number 2: 603-RC0402JR-070RL; Publisher: Texas Instruments; Supplier 2: Mouser; Supplier Part Number 3: 9232516; Supplier 3: Farnell; Published: 2008-06-26; RoHS: Y; Value1: 5%; MountType: SMT; Supplier 1: Digi-Key; PackageReference: 0402; Tolerance_%: 5%; Res_ohm: 0; SizeArea_mm2: 0.5; CompType: Resistor; LatestRevisionDate: 2017-03-09; PartNumber: RC0402JR-070RL; AEC Qualified: ?; ComponentLink1Description: Datasheet link; Supplier Part Number 1: 311-0.0JRCT-ND; Technology: Thick Film
R97 R108 = CMP-0026745-1: RES, 100 k, 1%, 0.063 W, 0402; Manufacturer: Samsung Electro-Mechanics; Power_W: 63mW; TempCo: 100 ppm/C; U/M: EA; Value: 100k; EIA_Code: E96; SizeX_mm: 1; SizeY_mm: 0.5; SizeZ_mm: 0.6; Value2: 0.063W; AEC Qualified: N; VDC_V: 80V; AEC Category: Q200; ComponentLink1URL: http://www.samsungsem.com/global/support/library/product-catalog/__icsFiles/afieldfile/2015/01/12/CHIP_RESISTOR_150112_1.pdf; Publisher: Texas Instruments; Published: 2008-06-26; Value_Code: 100k; RoHS: Y; Value1: 1%; MountType: SMT; Supplier 1: Digi-Key; PackageReference: 0402; Tolerance_%: 1%; Res_ohm: 100k; SizeArea_mm2: 0.5; CompType: Resistor; LatestRevisionDate: 2017-03-09; PartNumber: RC1005F104CS; ComponentLink1Description: Datasheet link; AEC Grade: N/A; Supplier Part Number 1: 1276-3432-1-ND; Technology: Thick Film
R101 R102 = CMP-0023490-1: RES, 249 k, 0.1%, 0.1 W, 0603; Manufacturer: Susumu Co Ltd; Power_W: 100mW; TempCo: 25 ppm/C; U/M: EA; Value: 249k; EIA_Code: E192; SizeX_mm: 1.6; SizeY_mm: 0.8; SizeZ_mm: 1; Value2: 0.1W; SizeArea_mm2: 1.28; VDC_V: 75V; AEC Category: Q200; ComponentLink1URL: http://www.susumu.co.jp/english/pdf/products-j01-01.pdf; Supplier Part Number 2: 754-RG1608P-2493-BT5; Publisher: Texas Instruments; Supplier 2: Mouser; Supplier Part Number 3: 9366245; Supplier 3: Farnell; Published: 2008-06-26; Value_Code: 249k; RoHS: Y; Value1: 0.1%; MountType: SMT; Supplier 1: Digi-Key; PackageReference: 0603; Tolerance_%: 0.1%; Res_ohm: 249k; CompType: Resistor; LatestRevisionDate: 2017-03-09; PartNumber: RG1608P-2493-B-T5; AEC Qualified: ?; ComponentLink1Description: Datasheet link; Supplier Part Number 1: RG16P249KBCT-ND; Technology: Metal Film
R105 R106 = CMP-0026660-1: RES, 1.00 M, 1%, 0.1 W, 0402; Manufacturer: Panasonic; Power_W: 100mW; TempCo: 100 ppm/C; Value_Code: 1M00; U/M: EA; Value: 1.00Meg; EIA_Code: E96; Res_ohm: 1M; SizeX_mm: 1; SizeY_mm: 0.5; SizeZ_mm: 0.6; Value2: 0.1W; VDC_V: 50V; AEC Category: Q200; ComponentLink1URL: http://industrial.panasonic.com/www-data/pdf/AOA0000/AOA0000CE2.pdf; Supplier Part Number 2: 64R5250; Publisher: Texas Instruments; Supplier 2: Newark; Supplier Part Number 3: 667-ERJ-2RKF1004X; Supplier 3: Mouser; Published: 2008-06-26; RoHS: Y; Value1: 1%; MountType: SMT; Supplier 1: Digi-Key; PackageReference: 0402; Tolerance_%: 1%; SizeArea_mm2: 0.5; CompType: Resistor; LatestRevisionDate: 2017-03-09; PartNumber: ERJ-2RKF1004X; AEC Qualified: ?; ComponentLink1Description: Datasheet link; Supplier Part Number 1: P1.00MLCT-ND; Technology: Thick Film
R111 = CRCW040210K0DHEDP: D10/CRCW0402-P 50 10K 0.5% ET7 e3; Manufacturer_Name: Vishay; Copyright: Copyright (C) 2026 Ultra Librarian. All rights reserved.; Manufacturer_Part_Number: CRCW040210K0DHEDP
U1 = CMP-0121143-2: USB Type-C® and USB PD Controller with Integrated Power Switches Optimized for Power Applications; Manufacturer: Texas Instruments; SizeZ_mm: 1mm; AEC Qualified: No; Interface: I2C,USB; Max Supply Voltage: 22V; Min Supply Voltage: 3V; Nominal Supply Current: 1-3mA; Number Of Ports: 1; Standoff Height: 0mm; TaMax_C: +85°C; TaMin_C: -40°C; TJmax_C: +125°C; Usb Standard: USB 3.1; AEC Category: Q200; CompType: IC; PackageReference: VQFN32; PartNumber: TPS26750RSMR; RoHS: TRUE; Operating Temperature Range: -40°C to +125°C; Part Number: TPS26750RSMR; Datasheet Path: datasheets/IC-TPS26750RSMR.pdf; helpURL: https://upverter.com/upn/revision/6ed298974f27b866/; Lead Free: Yes; ComponentLink1Description: Datasheet Link; ComponentLink1URL: http://www.ti.com/lit/ds/symlink/GPN.pdf; ComponentLink2Description: Product Folder; ComponentLink2URL: http://www.ti.com/product/GPN; ComponentLink3Description: Online Datasheet; ComponentLink3URL: http://www.ti.com/product/GPN/datasheet
U2 = CMP-0034161-1: USB Type-C® 48V EPR Port Protector: Short-to-VBUS Overvoltage and IEC ESD Protection; Manufacturer: Texas Instruments; SizeZ_mm: 0.8mm; AEC Qualified: No; Direction: Bidirectional; Number Of Channels: 4; Operating Supply Voltage: 3.3V; Standoff Height: 0mm; TJmax_C: +125°C; PackageReference: WQFN20; PartNumber: TPD4S480RUKR; RoHS: UNKNOWN; Operating Temperature Range: -40°C to +125°C; Part Number: TPD4S480RUKR; Datasheet Path: datasheets/IC-TPD4S480RUKR.pdf; helpURL: https://upverter.com/upn/revision/f85af9e28ce4aa72/; Interface: USB
U3 = CMP-0091847-1: EEPROM Memory IC 512Kb (64K x 8) I²C 1MHz 900ns 8-SOIC; Manufacturer: ON Semi; Standoff Height: 0.1mm; AEC Qualified: No; Max Supply Voltage: 5.5V; Interface: I2C; SizeZ_mm: 1.75mm; Memory Size: 512Kbits; Min Supply Voltage: 1.8V; ComponentLink1URL: https://www.onsemi.com/pub/Collateral/CAT24C512-D.PDF; PartNumber: CAT24C512WI-GT3; Mouser Part Number: 863-CAT24C512WI-GT3; ComponentLink1Description: Datasheet; Part Number: CAT24C512WI-GT3; Frequency_Fixed: 1MHz; Digikey Description: IC EEPROM 512K I2C 1MHZ 8SOIC; Digikey Part Number: CAT24C512WI-GT3OSCT-ND; Supplier 2: Mouser; Datasheet Path: datasheets/IC-CAT24C512WI-GT3.pdf; helpURL: https://upverter.com/upn/revision/5288ffb50134fafc/; Supplier Part Number 1: CAT24C512WI-GT3OSCT-ND; PackageReference: SOIC8; Supplier 1: Digikey; Memory Type: EEPROM; Lead Free: Yes; RoHS: TRUE; Mouser Description: EEPROM 512KB I2C SER EEPROM; Operating Temperature Range: -40°C to +85°C; datasheet: https://www.onsemi.com/pub/Collateral/CAT24C512-D.PDF; Supplier Part Number 2: 863-CAT24C512WI-GT3
U8 = EMC2101-R-ACZL-TR: Description; Manufacturer_Name: Microchip; Copyright: Copyright (C) 2025 Ultra Librarian. All rights reserved.; Manufacturer_Part_Number: EMC2101-R-ACZL-TR; RefDes: RefDes; Type: Type